# Altium schematic sheet 07_SPI_ADC.SchDoc
size A3
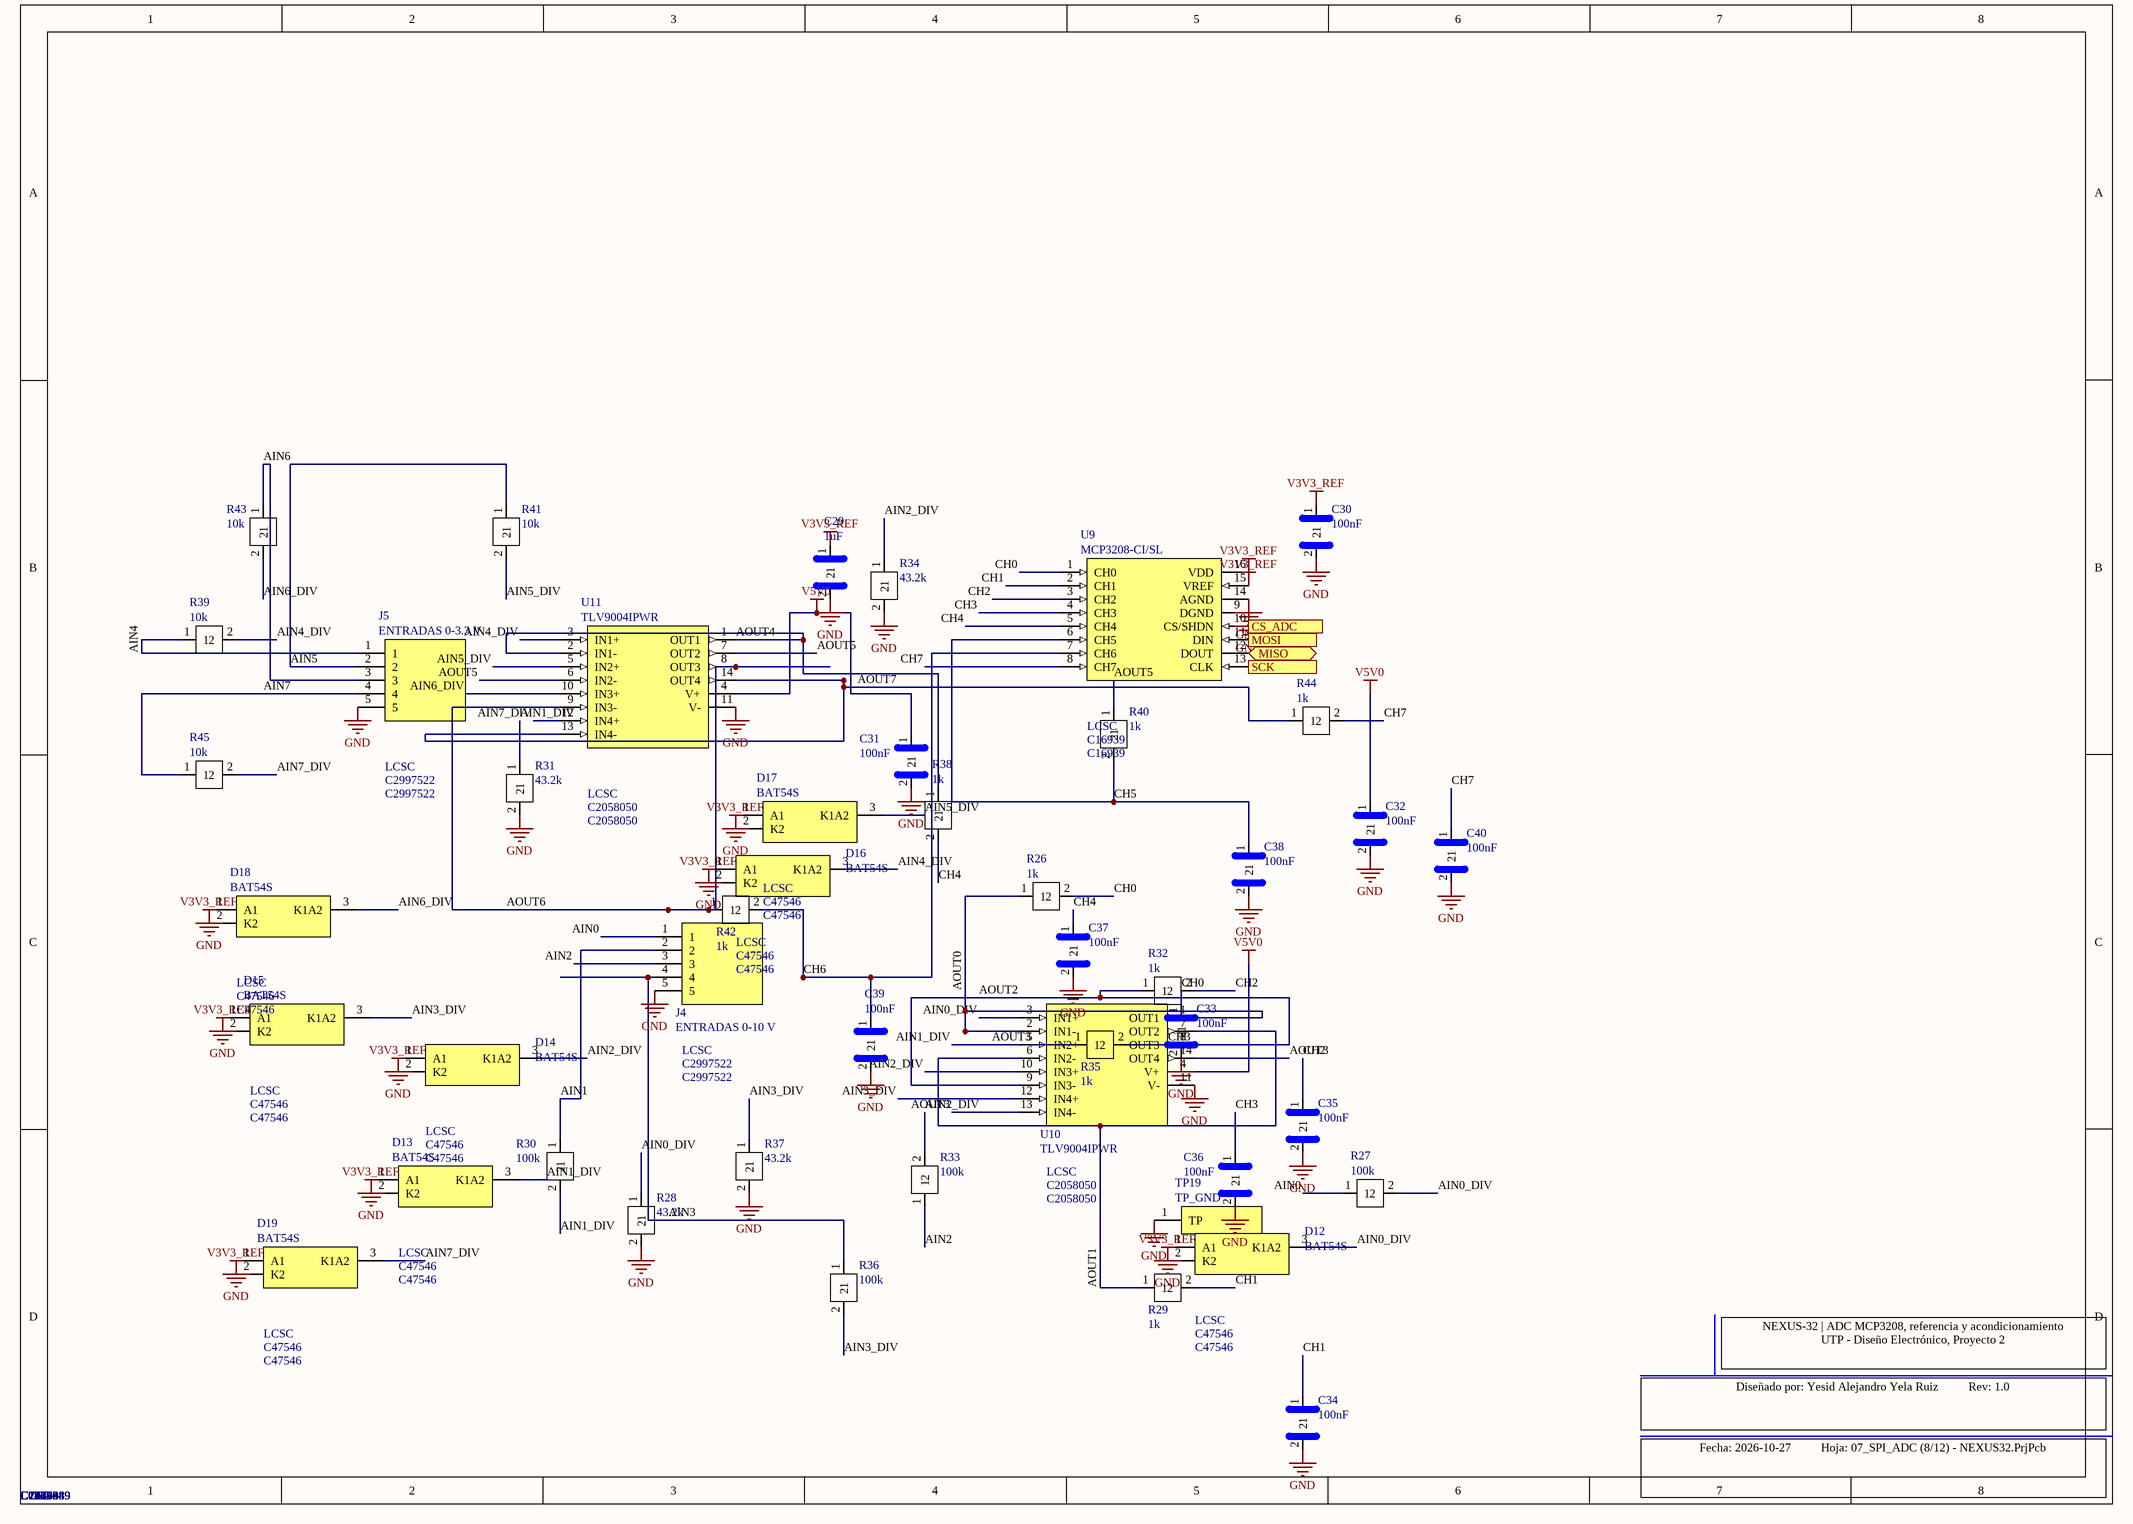
[diagram p0: 07_SPI_ADC.SchDoc]

## Parts
C29  1uF  Supplier 1: LCSC  Supplier Part Number 1: C15849  [R_0603]
C30  100nF  Supplier 1: LCSC  Supplier Part Number 1: C14663  [R_0603]
C31  100nF  Supplier 1: LCSC  Supplier Part Number 1: C14663  [R_0603]
C32  100nF  Supplier 1: LCSC  Supplier Part Number 1: C14663  [R_0603]
C33  100nF  Supplier 1: LCSC  Supplier Part Number 1: C14663  [R_0603]
C34  100nF  Supplier 1: LCSC  Supplier Part Number 1: C14663  [R_0603]
C35  100nF  Supplier 1: LCSC  Supplier Part Number 1: C14663  [R_0603]
C36  100nF  Supplier 1: LCSC  Supplier Part Number 1: C14663  [R_0603]
C37  100nF  Supplier 1: LCSC  Supplier Part Number 1: C14663  [R_0603]
C38  100nF  Supplier 1: LCSC  Supplier Part Number 1: C14663  [R_0603]
C39  100nF  Supplier 1: LCSC  Supplier Part Number 1: C14663  [R_0603]
C40  100nF  Supplier 1: LCSC  Supplier Part Number 1: C14663  [R_0603]
D12  BAT54S  Supplier 1: LCSC  Supplier Part Number 1: C47546  [SOT-23-3_DBZ]
D13  BAT54S  Supplier 1: LCSC  Supplier Part Number 1: C47546  [SOT-23-3_DBZ]
D14  BAT54S  Supplier 1: LCSC  Supplier Part Number 1: C47546  [SOT-23-3_DBZ]
D15  BAT54S  Supplier 1: LCSC  Supplier Part Number 1: C47546  [SOT-23-3_DBZ]
D16  BAT54S  Supplier 1: LCSC  Supplier Part Number 1: C47546  [SOT-23-3_DBZ]
D17  BAT54S  Supplier 1: LCSC  Supplier Part Number 1: C47546  [SOT-23-3_DBZ]
D18  BAT54S  Supplier 1: LCSC  Supplier Part Number 1: C47546  [SOT-23-3_DBZ]
D19  BAT54S  Supplier 1: LCSC  Supplier Part Number 1: C47546  [SOT-23-3_DBZ]
J4  ENTRADAS 0-10 V  Supplier 1: LCSC  Supplier Part Number 1: C2997522  [TB_DB127S-5.08-5P]
J5  ENTRADAS 0-3.3 V  Supplier 1: LCSC  Supplier Part Number 1: C2997522  [TB_DB127S-5.08-5P]
R26  1k  Supplier 1: LCSC  Supplier Part Number 1: C21190  [R_0603]
R27  100k  Supplier 1: LCSC  Supplier Part Number 1: C122538  [R_0603]
R28  43.2k  Supplier 1: LCSC  Supplier Part Number 1: C2989349  [R_0603]
R29  1k  Supplier 1: LCSC  Supplier Part Number 1: C21190  [R_0603]
R30  100k  Supplier 1: LCSC  Supplier Part Number 1: C122538  [R_0603]
R31  43.2k  Supplier 1: LCSC  Supplier Part Number 1: C2989349  [R_0603]
R32  1k  Supplier 1: LCSC  Supplier Part Number 1: C21190  [R_0603]
R33  100k  Supplier 1: LCSC  Supplier Part Number 1: C122538  [R_0603]
R34  43.2k  Supplier 1: LCSC  Supplier Part Number 1: C2989349  [R_0603]
R35  1k  Supplier 1: LCSC  Supplier Part Number 1: C21190  [R_0603]
R36  100k  Supplier 1: LCSC  Supplier Part Number 1: C122538  [R_0603]
R37  43.2k  Supplier 1: LCSC  Supplier Part Number 1: C2989349  [R_0603]
R38  1k  Supplier 1: LCSC  Supplier Part Number 1: C21190  [R_0603]
R39  10k  Supplier 1: LCSC  Supplier Part Number 1: C25804  [R_0603]
R40  1k  Supplier 1: LCSC  Supplier Part Number 1: C21190  [R_0603]
R41  10k  Supplier 1: LCSC  Supplier Part Number 1: C25804  [R_0603]
R42  1k  Supplier 1: LCSC  Supplier Part Number 1: C21190  [R_0603]
R43  10k  Supplier 1: LCSC  Supplier Part Number 1: C25804  [R_0603]
R44  1k  Supplier 1: LCSC  Supplier Part Number 1: C21190  [R_0603]
R45  10k  Supplier 1: LCSC  Supplier Part Number 1: C25804  [R_0603]
TP19  TP_GND  [TP_PAD_1.5mm]
U9  MCP3208-CI/SL  Supplier 1: LCSC  Supplier Part Number 1: C16939  [SOIC-16_3.9x9.9_P1.27]
U10  TLV9004IPWR  Supplier 1: LCSC  Supplier Part Number 1: C2058050  [TSSOP-14_PW_P0.65]
U11  TLV9004IPWR  Supplier 1: LCSC  Supplier Part Number 1: C2058050  [TSSOP-14_PW_P0.65]

## Ports
CS_ADC (in), MISO (bidir), MOSI (in), SCK (in)

## Nets
GND: C29.2 C30.2 C31.2 C32.2 C33.2 C34.2 C35.2 C36.2 C37.2 C38.2 C39.2 C40.2 D12.1(A1) D13.1(A1) D14.1(A1) D15.1(A1) D16.1(A1) D17.1(A1) D18.1(A1) D19.1(A1) J4.5 J5.5 R28.2 R31.2 R34.2 R37.2 TP19.1(TP) U9.9(DGND) U9.14(AGND) U10.11(V-) U11.11(V-)
V3V3_REF: C29.1 C30.1 D12.2(K2) D13.2(K2) D14.2(K2) D15.2(K2) D16.2(K2) D17.2(K2) D18.2(K2) D19.2(K2) U9.15(VREF) U9.16(VDD)
V5V0: C31.1 C32.1 U10.4(V+) U11.4(V+)
AIN0: J4.1 R27.1
AIN0_DIV: D12.3(K1A2) R27.2 R28.1 U10.3(IN1+)
AIN1: J4.2 R30.1
AIN1_DIV: D13.3(K1A2) R30.2 R31.1 U10.5(IN2+)
AIN2: J4.3 R33.1
AIN2_DIV: D14.3(K1A2) R33.2 R34.1 U10.10(IN3+)
AIN3: J4.4 R36.1
AIN3_DIV: D15.3(K1A2) R36.2 R37.1 U10.12(IN4+)
AIN4: J5.1 R39.1
AIN4_DIV: D16.3(K1A2) R39.2 U11.3(IN1+)
AIN5: J5.2 R41.1
AIN5_DIV: D17.3(K1A2) R41.2 U11.5(IN2+)
AIN6: J5.3 R43.1
AIN6_DIV: D18.3(K1A2) R43.2 U11.10(IN3+)
AIN7: J5.4 R45.1
AIN7_DIV: D19.3(K1A2) R45.2 U11.12(IN4+)
AOUT0: R26.1 U10.1(OUT1) U10.2(IN1-)
AOUT1: R29.1 U10.6(IN2-) U10.7(OUT2)
AOUT2: R32.1 U10.8(OUT3) U10.9(IN3-)
AOUT3: R35.1 U10.13(IN4-) U10.14(OUT4)
AOUT4: R38.1 U11.1(OUT1) U11.2(IN1-)
AOUT5: R40.1 U11.6(IN2-) U11.7(OUT2)
AOUT6: R42.1 U11.8(OUT3) U11.9(IN3-)
AOUT7: R44.1 U11.13(IN4-) U11.14(OUT4)
CH0: C33.1 R26.2 U9.1(CH0)
CH1: C34.1 R29.2 U9.2(CH1)
CH2: C35.1 R32.2 U9.3(CH2)
CH3: C36.1 R35.2 U9.4(CH3)
CH4: C37.1 R38.2 U9.5(CH4)
CH5: C38.1 R40.2 U9.6(CH5)
CH6: C39.1 R42.2 U9.7(CH6)
CH7: C40.1 R44.2 U9.8(CH7)
CS_ADC: U9.10(CS/SHDN) ; port CS_ADC
MISO: U9.12(DOUT) ; port MISO
MOSI: U9.11(DIN) ; port MOSI
SCK: U9.13(CLK) ; port SCK

## Notes on the sheet
- NEXUS-32 | ADC MCP3208, referencia y acondicionamiento
  UTP - Diseño Electrónico, Proyecto 2
- Diseñado por: Yesid Alejandro Yela Ruiz          Rev: 1.0
- Fecha: 2026-10-27          Hoja: 07_SPI_ADC (8/12) - NEXUS32.PrjPcb

## Library data of the parts
C29 = CAP_0603: Condensador ceramico SMD 0603; Manufacturer: Samsung; Manufacturer Part Number: CL10A105KB8NNNC; Datasheet: https://wmsc.lcsc.com/wmsc/upload/file/pdf/v2/lcsc/2206010045_UNI-ROYAL-Uniroyal-Elec-0603WAF1002T5E_C25804.pdf; LCSC Part #: C15849
C30-C40 = CAP_0603: Condensador ceramico SMD 0603; Manufacturer: YAGEO; Manufacturer Part Number: CC0603KRX7R9BB104; Datasheet: https://wmsc.lcsc.com/wmsc/upload/file/pdf/v2/lcsc/2206010045_UNI-ROYAL-Uniroyal-Elec-0603WAF1002T5E_C25804.pdf; LCSC Part #: C14663
D12-D19 = BAT54S,215: Doble diodo Schottky en serie 30V 200mA SOT-23 (Nexperia BAT54S,215); Manufacturer: Nexperia; Manufacturer Part Number: BAT54S,215; LCSC Part #: C47546; Datasheet: https://wmsc.lcsc.com/wmsc/upload/file/pdf/v2/lcsc/2410121943_Nexperia-BAT54S-215_C47546.pdf
J4 J5 = DB127S-5.08-5P-GN-S: Bornera tornillo 5 polos paso 5.08mm (Dorabo DB127S-5.08-5P-GN-S); Manufacturer: Dorabo; Manufacturer Part Number: DB127S-5.08-5P-GN-S; LCSC Part #: C2997522; Datasheet: https://wmsc.lcsc.com/wmsc/upload/file/pdf/v2/lcsc/2303211600_DORABO-DB127S-5-08-5P-GN_C2997522.pdf
R26 R29 R32 R35 R38 R40 R42 R44 = RES_0603: Resistencia SMD 0603; Manufacturer: UNI-ROYAL; Manufacturer Part Number: 0603WAF1001T5E; Datasheet: https://wmsc.lcsc.com/wmsc/upload/file/pdf/v2/lcsc/2206010045_UNI-ROYAL-Uniroyal-Elec-0603WAF1002T5E_C25804.pdf; LCSC Part #: C21190
R27 R30 R33 R36 = RES_0603: Resistencia SMD 0603; Manufacturer: YAGEO; Manufacturer Part Number: RT0603BRD07100KL; Datasheet: https://wmsc.lcsc.com/wmsc/upload/file/pdf/v2/lcsc/2206010045_UNI-ROYAL-Uniroyal-Elec-0603WAF1002T5E_C25804.pdf; LCSC Part #: C122538
R28 R31 R34 R37 = RES_0603: Resistencia SMD 0603; Manufacturer: UNI-ROYAL; Manufacturer Part Number: TC0325B4322T5F; Datasheet: https://wmsc.lcsc.com/wmsc/upload/file/pdf/v2/lcsc/2206010045_UNI-ROYAL-Uniroyal-Elec-0603WAF1002T5E_C25804.pdf; LCSC Part #: C2989349
R39 R41 R43 R45 = RES_0603: Resistencia SMD 0603; Manufacturer: UNI-ROYAL; Manufacturer Part Number: 0603WAF1002T5E; Datasheet: https://wmsc.lcsc.com/wmsc/upload/file/pdf/v2/lcsc/2206010045_UNI-ROYAL-Uniroyal-Elec-0603WAF1002T5E_C25804.pdf; LCSC Part #: C25804
TP19 = TESTPOINT: Punto de prueba, pad desnudo de 1.5mm sin montaje; Manufacturer: n/a; Manufacturer Part Number: TP_PAD_1.5mm; Datasheet: https://wmsc.lcsc.com/wmsc/upload/file/pdf/v2/lcsc/2206010045_UNI-ROYAL-Uniroyal-Elec-0603WAF1002T5E_C25804.pdf
U9 = MCP3208-CI/SL: ADC 12 bits 8 canales SPI SOIC-16 (Microchip MCP3208-CI/SL); Manufacturer: Microchip Technology; Manufacturer Part Number: MCP3208-CI/SL; LCSC Part #: C16939; Datasheet: https://ww1.microchip.com/downloads/en/DeviceDoc/21298e.pdf
U10 U11 = TLV9004IPWR: Amplificador operacional cuadruple RRIO 1MHz TSSOP-14 (TI TLV9004IPWR); Manufacturer: Texas Instruments; Manufacturer Part Number: TLV9004IPWR; LCSC Part #: C2058050; Datasheet: https://www.ti.com/lit/ds/symlink/tlv9004.pdf